# Altium schematic sheet Servo_Signal_Buf.SchDoc
size A; DocumentNumber: 7; SheetNumber: 7; SheetTotal: 14
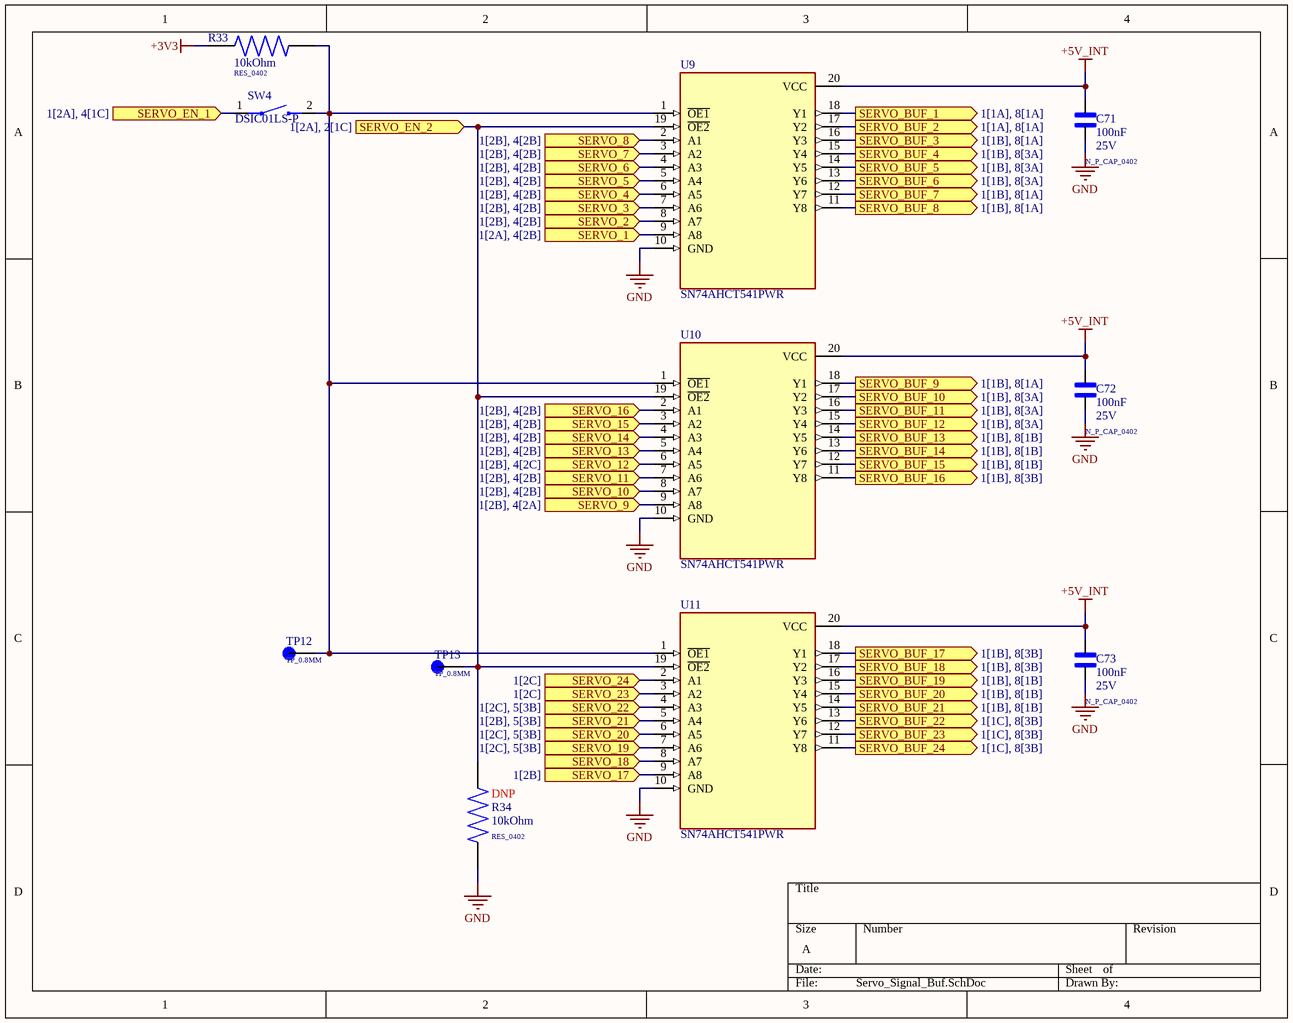
[diagram p0: Servo_Signal_Buf.SchDoc]

## Parts
C71  N_P_CAP_0402  value 100nF  Rated Voltage: 25V  [N_P_CAP_0402]
C72  N_P_CAP_0402  value 100nF  Rated Voltage: 25V  [N_P_CAP_0402]
C73  N_P_CAP_0402  value 100nF  Rated Voltage: 25V  [N_P_CAP_0402]
R33  RES_0402  value 10kOhm  [RES_0402]
R34  RES_0402  value 10kOhm  [RES_0402]
SW4  MPN: DSIC01LS-P  [SW_KAE01SGGT]  (hidden comment: SW_KAE01SGGT)
TP12  TP_0.8MM  [TP_0.8MM]
TP13  TP_0.8MM  [TP_0.8MM]
U9  SN74AHCT541PWR  [SOP65P640X120-20N]
U10  SN74AHCT541PWR  [SOP65P640X120-20N]
U11  SN74AHCT541PWR  [SOP65P640X120-20N]

## Ports
SERVO_1 (in, see 1[2A], 4[2B]), SERVO_2 (in, see 1[2B], 4[2B]), SERVO_3 (in, see 1[2B], 4[2B]), SERVO_4 (in, see 1[2B], 4[2B]), SERVO_5 (in, see 1[2B], 4[2B]), SERVO_6 (in, see 1[2B], 4[2B]), SERVO_7 (in, see 1[2B], 4[2B]), SERVO_8 (in, see 1[2B], 4[2B]), SERVO_9 (in, see 1[2B], 4[2A]), SERVO_10 (in, see 1[2B], 4[2B]), SERVO_11 (in, see 1[2B], 4[2B]), SERVO_12 (in, see 1[2B], 4[2C]), SERVO_13 (in, see 1[2B], 4[2B]), SERVO_14 (in, see 1[2B], 4[2B]), SERVO_15 (in, see 1[2B], 4[2B]), SERVO_16 (in, see 1[2B], 4[2B]), SERVO_17 (in, see 1[2B]), SERVO_18 (in), SERVO_19 (in, see 1[2C], 5[3B]), SERVO_20 (in, see 1[2C], 5[3B]), SERVO_21 (in, see 1[2B], 5[3B]), SERVO_22 (in, see 1[2C], 5[3B]), SERVO_23 (in, see 1[2C]), SERVO_24 (in, see 1[2C]), SERVO_BUF_1 (out, see 1[1A], 8[1A]), SERVO_BUF_2 (out, see 1[1A], 8[1A]), SERVO_BUF_3 (out, see 1[1B], 8[1A]), SERVO_BUF_4 (out, see 1[1B], 8[3A]), SERVO_BUF_5 (out, see 1[1B], 8[3A]), SERVO_BUF_6 (out, see 1[1B], 8[3A]), SERVO_BUF_7 (out, see 1[1B], 8[1A]), SERVO_BUF_8 (out, see 1[1B], 8[1A]), SERVO_BUF_9 (out, see 1[1B], 8[1A]), SERVO_BUF_10 (out, see 1[1B], 8[3A]), SERVO_BUF_11 (out, see 1[1B], 8[3A]), SERVO_BUF_12 (out, see 1[1B], 8[3A]), SERVO_BUF_13 (out, see 1[1B], 8[1B]), SERVO_BUF_14 (out, see 1[1B], 8[1B]), SERVO_BUF_15 (out, see 1[1B], 8[1B]), SERVO_BUF_16 (out, see 1[1B], 8[3B]), SERVO_BUF_17 (out, see 1[1B], 8[3B]), SERVO_BUF_18 (out, see 1[1B], 8[3B]), SERVO_BUF_19 (out, see 1[1B], 8[1B]), SERVO_BUF_20 (out, see 1[1B], 8[1B]), SERVO_BUF_21 (out, see 1[1B], 8[1B]), SERVO_BUF_22 (out, see 1[1C], 8[3B]), SERVO_BUF_23 (out, see 1[1C], 8[3B]), SERVO_BUF_24 (out, see 1[1C], 8[3B]), SERVO_EN_1 (in, see 1[2A], 4[1C]), SERVO_EN_2 (in, see 1[2A], 2[1C])

## Nets
+3V3: R33.1
+5V_INT: C71.2 C72.2 C73.2 U9.20(VCC) U10.20(VCC) U11.20(VCC)
GND: C71.1 C72.1 C73.1 R34.2 U9.10(GND) U10.10(GND) U11.10(GND)
SERVO_1: U9.9(A8) ; port SERVO_1
SERVO_2: U9.8(A7) ; port SERVO_2
SERVO_3: U9.7(A6) ; port SERVO_3
SERVO_4: U9.6(A5) ; port SERVO_4
SERVO_5: U9.5(A4) ; port SERVO_5
SERVO_6: U9.4(A3) ; port SERVO_6
SERVO_7: U9.3(A2) ; port SERVO_7
SERVO_8: U9.2(A1) ; port SERVO_8
SERVO_9: U10.9(A8) ; port SERVO_9
SERVO_10: U10.8(A7) ; port SERVO_10
SERVO_11: U10.7(A6) ; port SERVO_11
SERVO_12: U10.6(A5) ; port SERVO_12
SERVO_13: U10.5(A4) ; port SERVO_13
SERVO_14: U10.4(A3) ; port SERVO_14
SERVO_15: U10.3(A2) ; port SERVO_15
SERVO_16: U10.2(A1) ; port SERVO_16
SERVO_17: U11.9(A8) ; port SERVO_17
SERVO_18: U11.8(A7) ; port SERVO_18
SERVO_19: U11.7(A6) ; port SERVO_19
SERVO_20: U11.6(A5) ; port SERVO_20
SERVO_21: U11.5(A4) ; port SERVO_21
SERVO_22: U11.4(A3) ; port SERVO_22
SERVO_23: U11.3(A2) ; port SERVO_23
SERVO_24: U11.2(A1) ; port SERVO_24
SERVO_BUF_1: U9.18(Y1) ; port SERVO_BUF_1
SERVO_BUF_2: U9.17(Y2) ; port SERVO_BUF_2
SERVO_BUF_3: U9.16(Y3) ; port SERVO_BUF_3
SERVO_BUF_4: U9.15(Y4) ; port SERVO_BUF_4
SERVO_BUF_5: U9.14(Y5) ; port SERVO_BUF_5
SERVO_BUF_6: U9.13(Y6) ; port SERVO_BUF_6
SERVO_BUF_7: U9.12(Y7) ; port SERVO_BUF_7
SERVO_BUF_8: U9.11(Y8) ; port SERVO_BUF_8
SERVO_BUF_9: U10.18(Y1) ; port SERVO_BUF_9
SERVO_BUF_10: U10.17(Y2) ; port SERVO_BUF_10
SERVO_BUF_11: U10.16(Y3) ; port SERVO_BUF_11
SERVO_BUF_12: U10.15(Y4) ; port SERVO_BUF_12
SERVO_BUF_13: U10.14(Y5) ; port SERVO_BUF_13
SERVO_BUF_14: U10.13(Y6) ; port SERVO_BUF_14
SERVO_BUF_15: U10.12(Y7) ; port SERVO_BUF_15
SERVO_BUF_16: U10.11(Y8) ; port SERVO_BUF_16
SERVO_BUF_17: U11.18(Y1) ; port SERVO_BUF_17
SERVO_BUF_18: U11.17(Y2) ; port SERVO_BUF_18
SERVO_BUF_19: U11.16(Y3) ; port SERVO_BUF_19
SERVO_BUF_20: U11.15(Y4) ; port SERVO_BUF_20
SERVO_BUF_21: U11.14(Y5) ; port SERVO_BUF_21
SERVO_BUF_22: U11.13(Y6) ; port SERVO_BUF_22
SERVO_BUF_23: U11.12(Y7) ; port SERVO_BUF_23
SERVO_BUF_24: U11.11(Y8) ; port SERVO_BUF_24
SERVO_EN_1: SW4.1 ; port SERVO_EN_1
SERVO_EN_2: R34.1 TP13.TP U9.19(~{OE2}) U10.19(~{OE2}) U11.19(~{OE2}) ; port SERVO_EN_2
NetR33_2: R33.2 SW4.2 TP12.TP U9.1(~{OE1}) U10.1(~{OE1}) U11.1(~{OE1})

## Notes on the sheet
- (near R34) DNP

## Library data of the parts
C71-C73 = N_P_CAP: GENERIC NON-POLARIZED CAP; Temperature Coefficient: X7R; LCSC Part Number: C105883; Tolerance: *; MF: *; ESR: *; MPN: *
R33 R34 = RES: GENERIC RES; Tolerance: 1%; Power Rating: *; MPN: *; Rated Voltage: *; Temperature Coefficient: *; LCSC Part Number: C60490
SW4 = SW_DIP_SPST_1P: GENERIC DIP SWITCH SPST 1 POLE; MF: XKB Connection; LCSC Part Number: C600988
TP12 TP13 = TEST_POINT: GENERIC TEST POINT; MF: *; MPN: *
U9-U11 = SN74AHCT541PWR: Octal Buffers/Drivers With 3-State Outputs 20-TSSOP -40 to 125; MF: Texas Instruments; DigiKey Part Number: 296-1120-1-ND; Package: TSSOP-20 Texas Instruments; MPN: SN74AHCT541PWR; LCSC Part Number: C50989